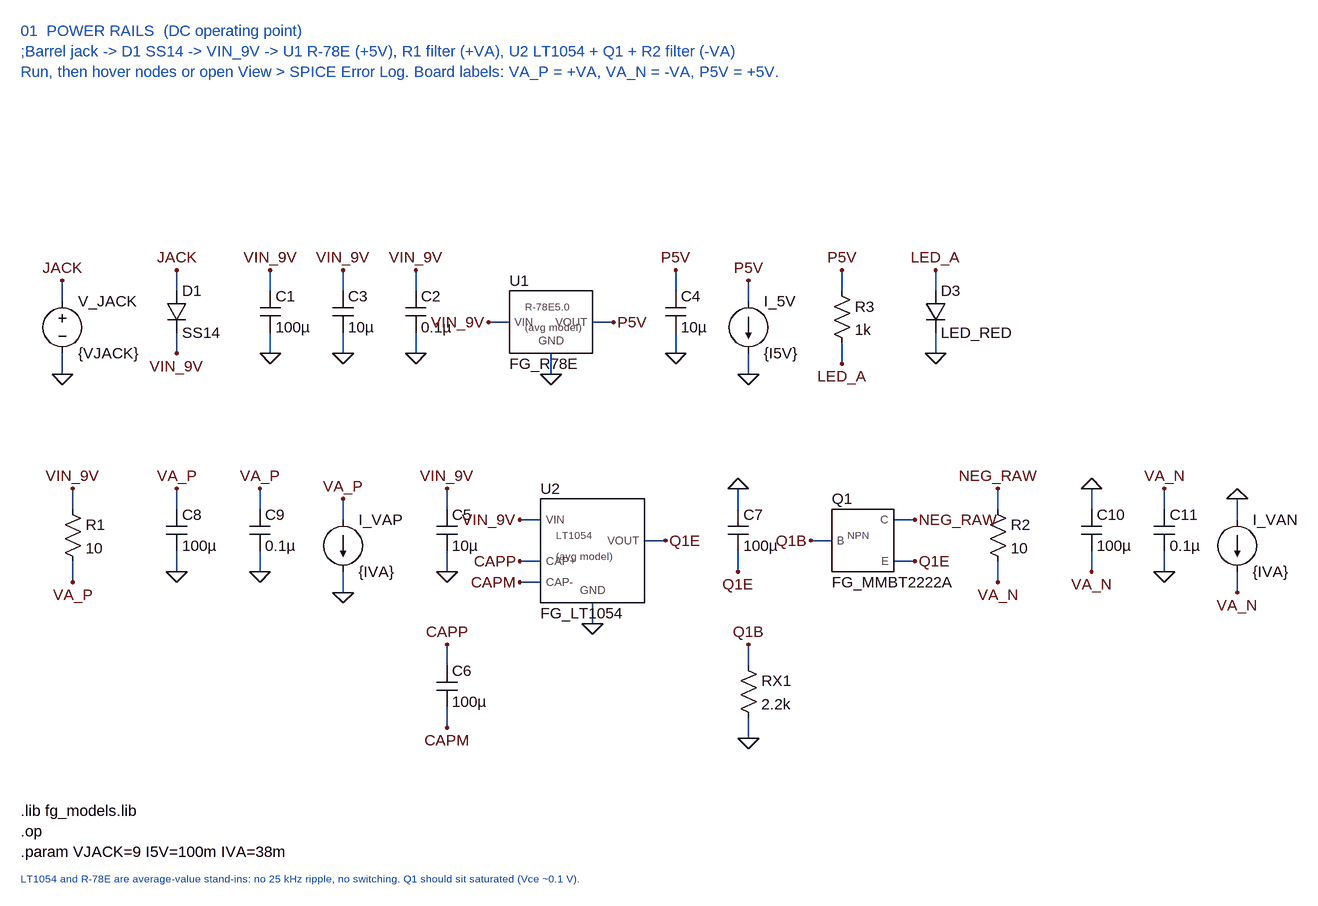
[diagram p0: schematic 01_power_rails.asc]
01_power_rails.asc, the LTspice schematic file:
Version 4
SHEET 1 2400 1600
WIRE 176 0 176 -32
WIRE 320 0 320 -32
WIRE 432 0 432 -32
WIRE 544 0 544 -32
WIRE 944 0 944 -32
WIRE 1200 0 1200 -32
WIRE 1344 0 1344 -32
WIRE 0 16 0 -16
WIRE 1056 16 1056 -16
WIRE 688 48 656 48
WIRE 848 48 816 48
WIRE 176 96 176 64
WIRE 320 96 320 64
WIRE 432 96 432 64
WIRE 544 96 544 64
WIRE 944 96 944 64
WIRE 1344 96 1344 64
WIRE 1200 112 1200 80
WIRE 0 128 0 96
WIRE 752 128 752 96
WIRE 1056 128 1056 96
WIRE 16 336 16 304
WIRE 176 336 176 304
WIRE 304 336 304 304
WIRE 592 336 592 304
WIRE 1040 336 1040 304
WIRE 1440 336 1440 304
WIRE 1584 336 1584 304
WIRE 1696 336 1696 304
WIRE 432 352 432 320
WIRE 736 352 704 352
WIRE 1312 352 1280 352
WIRE 1808 352 1808 320
WIRE 928 384 896 384
WIRE 1184 384 1152 384
WIRE 736 416 704 416
WIRE 1312 416 1280 416
WIRE 176 432 176 400
WIRE 304 432 304 400
WIRE 592 432 592 400
WIRE 1040 432 1040 400
WIRE 1584 432 1584 400
WIRE 1696 432 1696 400
WIRE 16 448 16 416
WIRE 736 448 704 448
WIRE 1440 448 1440 416
WIRE 432 464 432 432
WIRE 1808 464 1808 432
WIRE 816 512 816 480
WIRE 592 576 592 544
WIRE 1056 576 1056 544
WIRE 592 672 592 640
WIRE 1056 688 1056 656
FLAG 0 -16 JACK
FLAG 0 128 0
FLAG 176 -32 JACK
FLAG 176 96 VIN_9V
FLAG 320 -32 VIN_9V
FLAG 320 96 0
FLAG 432 -32 VIN_9V
FLAG 432 96 0
FLAG 544 -32 VIN_9V
FLAG 544 96 0
FLAG 656 48 VIN_9V
FLAG 752 128 0
FLAG 848 48 P5V
FLAG 944 -32 P5V
FLAG 944 96 0
FLAG 1056 -16 P5V
FLAG 1056 128 0
FLAG 1200 -32 P5V
FLAG 1200 112 LED_A
FLAG 1344 -32 LED_A
FLAG 1344 96 0
FLAG 16 304 VIN_9V
FLAG 16 448 VA_P
FLAG 176 304 VA_P
FLAG 176 432 0
FLAG 304 304 VA_P
FLAG 304 432 0
FLAG 432 320 VA_P
FLAG 432 464 0
FLAG 592 304 VIN_9V
FLAG 592 432 0
FLAG 704 352 VIN_9V
FLAG 816 512 0
FLAG 704 416 CAPP
FLAG 704 448 CAPM
FLAG 928 384 Q1E
FLAG 592 544 CAPP
FLAG 592 672 CAPM
FLAG 1040 304 0
FLAG 1040 432 Q1E
FLAG 1312 352 NEG_RAW
FLAG 1152 384 Q1B
FLAG 1312 416 Q1E
FLAG 1056 544 Q1B
FLAG 1056 688 0
FLAG 1440 304 NEG_RAW
FLAG 1440 448 VA_N
FLAG 1584 304 0
FLAG 1584 432 VA_N
FLAG 1696 304 VA_N
FLAG 1696 432 0
FLAG 1808 320 0
FLAG 1808 464 VA_N
SYMBOL voltage 0 0 R0
SYMATTR InstName V_JACK
SYMATTR Value {VJACK}
SYMBOL diode 160 0 R0
SYMATTR InstName D1
SYMATTR Value SS14
SYMBOL cap 304 0 R0
SYMATTR InstName C1
SYMATTR Value 100µ
SYMBOL cap 416 0 R0
SYMATTR InstName C3
SYMATTR Value 10µ
SYMBOL cap 528 0 R0
SYMATTR InstName C2
SYMATTR Value 0.1µ
SYMBOL FG_R78E 688 0 R0
SYMATTR InstName U1
SYMBOL cap 928 0 R0
SYMATTR InstName C4
SYMATTR Value 10µ
SYMBOL current 1056 16 R0
SYMATTR InstName I_5V
SYMATTR Value {I5V}
SYMBOL res 1184 -16 R0
SYMATTR InstName R3
SYMATTR Value 1k
SYMBOL diode 1328 0 R0
SYMATTR InstName D3
SYMATTR Value LED_RED
SYMBOL res 0 320 R0
SYMATTR InstName R1
SYMATTR Value 10
SYMBOL cap 160 336 R0
SYMATTR InstName C8
SYMATTR Value 100µ
SYMBOL cap 288 336 R0
SYMATTR InstName C9
SYMATTR Value 0.1µ
SYMBOL current 432 352 R0
SYMATTR InstName I_VAP
SYMATTR Value {IVA}
SYMBOL cap 576 336 R0
SYMATTR InstName C5
SYMATTR Value 10µ
SYMBOL FG_LT1054 736 320 R0
SYMATTR InstName U2
SYMBOL cap 576 576 R0
SYMATTR InstName C6
SYMATTR Value 100µ
SYMBOL cap 1024 336 R0
SYMATTR InstName C7
SYMATTR Value 100µ
SYMBOL FG_MMBT2222A 1184 336 R0
SYMATTR InstName Q1
SYMBOL res 1040 560 R0
SYMATTR InstName RX1
SYMATTR Value 2.2k
SYMBOL res 1424 320 R0
SYMATTR InstName R2
SYMATTR Value 10
SYMBOL cap 1568 336 R0
SYMATTR InstName C10
SYMATTR Value 100µ
SYMBOL cap 1680 336 R0
SYMATTR InstName C11
SYMATTR Value 0.1µ
SYMBOL current 1808 352 R0
SYMATTR InstName I_VAN
SYMATTR Value {IVA}
TEXT -64 -400 Left 2 ;01  POWER RAILS  (DC operating point)\n;Barrel jack -> D1 SS14 -> VIN_9V -> U1 R-78E (+5V), R1 filter (+VA), U2 LT1054 + Q1 + R2 filter (-VA)\nRun, then hover nodes or open View > SPICE Error Log. Board labels: VA_P = +VA, VA_N = -VA, P5V = +5V.
TEXT -64 800 Left 2 !.lib fg_models.lib\n.op\n.param VJACK=9 I5V=100m IVA=38m
TEXT -64 904 Left 1 ;LT1054 and R-78E are average-value stand-ins: no 25 kHz ripple, no switching. Q1 should sit saturated (Vce ~0.1 V).

The netlist it stands for:
* 01_power_rails.asc
V_JACK JACK 0 {VJACK}
D1 JACK VIN_9V SS14
C1 VIN_9V 0 100µ
C3 VIN_9V 0 10µ
C2 VIN_9V 0 0.1µ
XU1 VIN_9V 0 P5V FG_R78E FG_R78E  ; pins VIN GND VOUT
C4 P5V 0 10µ
I_5V P5V 0 {I5V}
R3 P5V LED_A 1k
D3 LED_A 0 LED_RED
R1 VIN_9V VA_P 10
C8 VA_P 0 100µ
C9 VA_P 0 0.1µ
I_VAP VA_P 0 {IVA}
C5 VIN_9V 0 10µ
XU2 VIN_9V 0 CAPP CAPM Q1E FG_LT1054 FG_LT1054  ; pins VIN GND CAP+ CAP- VOUT
C6 CAPP CAPM 100µ
C7 0 Q1E 100µ
XQ1 NEG_RAW Q1B Q1E FG_MMBT2222A FG_MMBT2222A  ; pins C B E
RX1 Q1B 0 2.2k
R2 NEG_RAW VA_N 10
C10 0 VA_N 100µ
C11 VA_N 0 0.1µ
I_VAN 0 VA_N {IVA}
.model D D
.lib standard.dio
* 01  POWER RAILS  (DC operating point)
* ;Barrel jack -> D1 SS14 -> VIN_9V -> U1 R-78E (+5V), R1 filter (+VA), U2 LT1054 + Q1 + R2 filter (-VA)
* Run, then hover nodes or open View > SPICE Error Log. Board labels: VA_P = +VA, VA_N = -VA, P5V = +5V.
.lib fg_models.lib
.op
.param VJACK=9 I5V=100m IVA=38m
* LT1054 and R-78E are average-value stand-ins: no 25 kHz ripple, no switching. Q1 should sit saturated (Vce ~0.1 V).
.backanno
.end